# Altium schematic sheet [02] - DIAGRAMA.SchDoc
size A3; DocumentNumber: 3; SheetNumber: 3; SheetTotal: 6
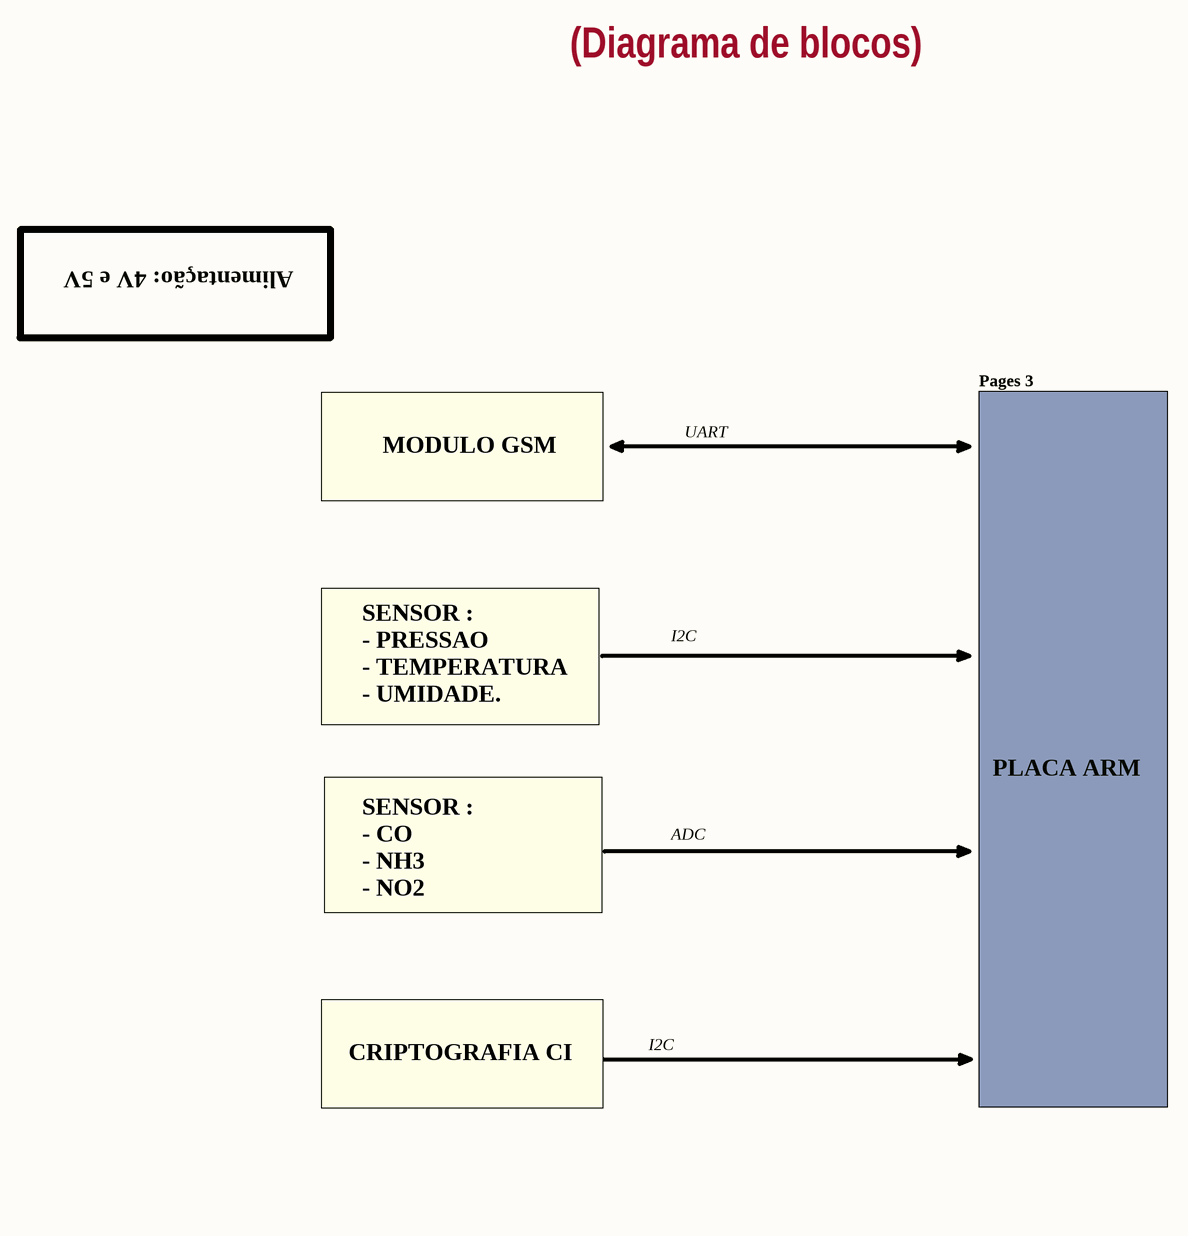
[diagram p0: [02] - DIAGRAMA.SchDoc]

## Notes on the sheet
- (Diagrama de blocos)
- Alimentação: 4V e 5V
- Pages 3
- MODULO GSM
- UART
- I2C
- SENSOR :
  - PRESSAO
  - TEMPERATURA
  - UMIDADE.
- PLACA ARM
- ADC
- SENSOR :
  - CO
  - NH3
  - NO2
- CRIPTOGRAFIA CI
- CLOCKS (CPU & PCIE)
- Project:
- Revision:
- Engineer:
- Title:
- Pag
- of
- Embedded Things
- Date:
- Hour:
- Variant: